# Altium project Karta_Radiowa_ILS_TETRA.PrjPcb (part 4 of 9)

## Sheet CLOC_DISTR.SchDoc: Clock distributions
size A3; SheetNumber: 4; SheetTotal: 17
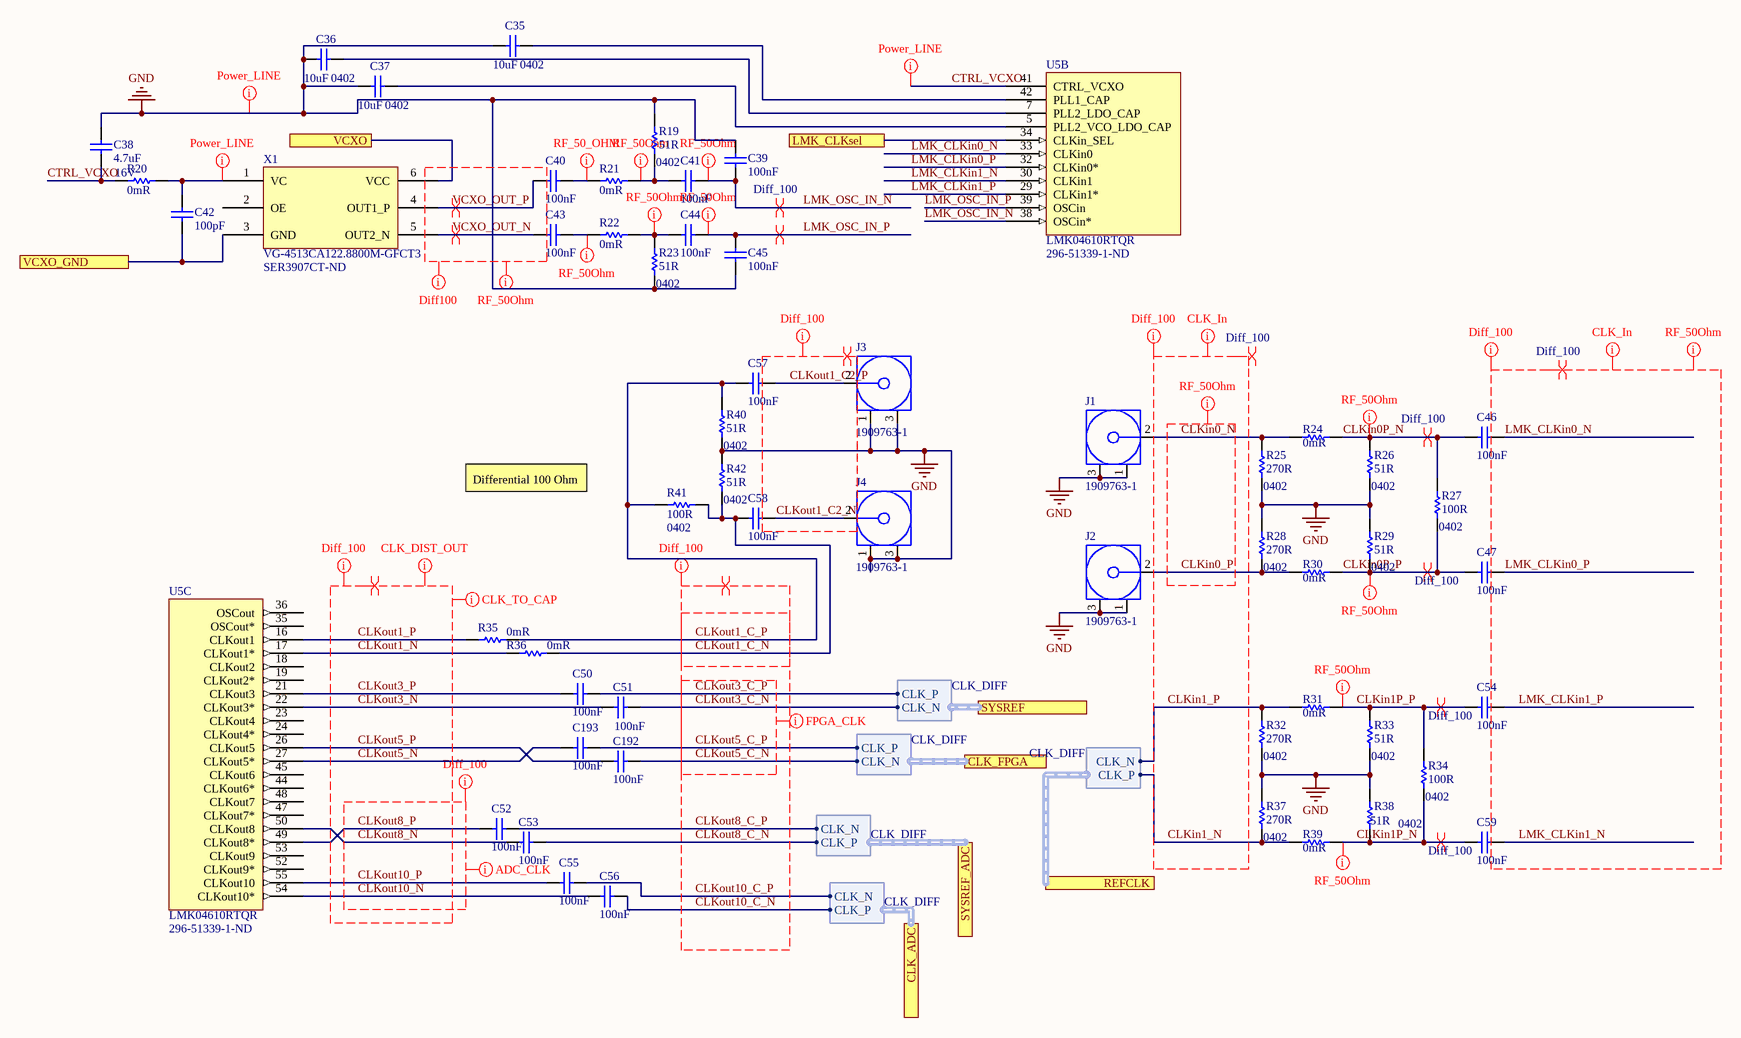
[diagram p4: CLOC_DISTR.SchDoc]

### Parts
C35  10uF  Case/Package: 0402  [CAP 0402/1005 RF KK]
C36  10uF  Case/Package: 0402  [CAP 0402/1005 RF KK]
C37  10uF  Case/Package: 0402  [CAP 0402/1005 RF KK]
C38  4.7uF  Voltage: 16V  [CAP 0603/1608 RF]
C39  100nF  [CAP 0201/0603 KK]
C40  100nF  [CAP 0201/0603 KK]
C41  100nF  [CAP 0201/0603 KK]
C42  100pF  [CAP 0402/1005 RF KK]
C43  100nF  [CAP 0201/0603 KK]
C44  100nF  [CAP 0201/0603 KK]
C45  100nF  [CAP 0201/0603 KK]
C46  100nF  [CAP 0201/0603 KK]
C47  100nF  [CAP 0201/0603 KK]
C50  100nF  [CAP 0201/0603 KK]
C51  100nF  [CAP 0201/0603 KK]
C52  100nF  [CAP 0201/0603 KK]
C53  100nF  [CAP 0201/0603 KK]
C54  100nF  [CAP 0201/0603 KK]
C55  100nF  [CAP 0201/0603 KK]
C56  100nF  [CAP 0201/0603 KK]
C57  100nF  [CAP 0201/0603 KK]
C58  100nF  [CAP 0201/0603 KK]
C59  100nF  [CAP 0201/0603 KK]
C192  100nF  [CAP 0201/0603 KK]
C193  100nF  [CAP 0201/0603 KK]
J1  1909763-1  [TECO-1909763-1_V]
J2  1909763-1  [TECO-1909763-1_V]
J3  1909763-1  [TECO-1909763-1_V]
J4  1909763-1  [TECO-1909763-1_V]
R19  51R  Case/Package: 0402  [RES 0402/1005 RF KK]
R20  0mR  [RES 0402/1005 RF KK]
R21  0mR  [RES 0402/1005 RF KK]
R22  0mR  [RES 0402/1005 RF KK]
R23  51R  Case/Package: 0402  [RES 0402/1005 RF KK]
R24  0mR  [RES 0402/1005 RF KK]
R25  270R  Case/Package: 0402  [RES 0402/1005 RF KK]
R26  51R  Case/Package: 0402  [RES 0402/1005 RF KK]
R27  100R  Case/Package: 0402  [RES 0402/1005 RF KK]
R28  270R  Case/Package: 0402  [RES 0402/1005 RF KK]
R29  51R  Case/Package: 0402  [RES 0402/1005 RF KK]
R30  0mR  [RES 0402/1005 RF KK]
R31  0mR  [RES 0402/1005 RF KK]
R32  270R  Case/Package: 0402  [RES 0402/1005 RF KK]
R33  51R  Case/Package: 0402  [RES 0402/1005 RF KK]
R34  100R  Case/Package: 0402  [RES 0402/1005 RF KK]
R35  0mR  [RES 0402/1005 RF KK]
R36  0mR  [RES 0402/1005 RF KK]
R37  270R  Case/Package: 0402  [RES 0402/1005 RF KK]
R38  51R  Case/Package: 0402  [RES 0402/1005 RF KK]
R39  0mR  [RES 0402/1005 RF KK]
R40  51R  Case/Package: 0402  [RES 0402/1005 RF KK]
R41  100R  Case/Package: 0402  [RES 0402/1005 RF KK]
R42  51R  Case/Package: 0402  [RES 0402/1005 RF KK]
U5  LMK04610RTQR  Supplier Part Number 1: 296-51339-1-ND  [LMK04610]  (parts B,C of 4)
X1  VG-4513CA122.8800M-GFCT3  Supplier Part Number 1: SER3907CT-ND  [VG-4513CA]

### Ports
CLK_ADC (harness CLK_DIFF), CLK_FPGA (harness CLK_DIFF), LMK_CLKsel, REFCLK (harness CLK_DIFF), SYSREF (harness CLK_DIFF), SYSREF_ADC (harness CLK_DIFF), VCXO, VCXO_GND

### Harnesses
CLK_DIFF: CLK_N, CLK_P
CLK_DIFF: CLK_P, CLK_N

### Nets
GND: C35.1 C36.1 C37.1 C38.2 C39.2 C45.1 J1.1 J1.3 J2.1 J2.3 J3.1 J3.3 J4.1 J4.3 R19.2 R23.1 R25.1 R26.1 R28.2 R29.2 R32.1 R33.1 R37.2 R38.2 R40.1 R42.2
CLKin0_N: J1.2 R24.1 R25.2
CLKin0_P: J2.2 R28.1 R30.1
CLKin0P_N: C46.2 R24.2 R26.2 R27.2
CLKin0P_P: C47.2 R27.1 R29.1 R30.2
CLKin1_N: R37.1 R39.1 ; port REFCLK.CLK_P
CLKin1_P: R31.1 R32.2 ; port REFCLK.CLK_N
CLKin1P_N: C59.2 R34.1 R38.1 R39.2
CLKin1P_P: C54.2 R31.2 R33.2 R34.2
CLKout1_C2_N: C58.1 J4.2
CLKout1_C2_P: C57.1 J3.2
CLKout1_C_N: C58.2 R36.2 R41.2 R42.1
CLKout1_C_P: C57.2 R35.2 R40.2 R41.1
CLKout1_N: R36.1 U5.17(CLKout1*)
CLKout1_P: R35.1 U5.16(CLKout1)
CLKout3_C_N: C51.1 ; port SYSREF.CLK_N
CLKout3_C_P: C50.1 ; port SYSREF.CLK_P
CLKout3_N: C51.2 U5.22(CLKout3*)
CLKout3_P: C50.2 U5.21(CLKout3)
CLKout5_C_N: C192.1 ; port CLK_FPGA.CLK_N
CLKout5_C_P: C193.1 ; port CLK_FPGA.CLK_P
CLKout5_N: C193.2 U5.27(CLKout5*)
CLKout5_P: C192.2 U5.26(CLKout5)
CLKout8_C_N: C53.1 ; port SYSREF_ADC.CLK_P
CLKout8_C_P: C52.1 ; port SYSREF_ADC.CLK_N
CLKout8_N: C53.2 U5.50(CLKout8)
CLKout8_P: C52.2 U5.49(CLKout8*)
CLKout10_C_N: C56.1 ; port CLK_ADC.CLK_P
CLKout10_C_P: C55.1 ; port CLK_ADC.CLK_N
CLKout10_N: C56.2 U5.54(CLKout10*)
CLKout10_P: C55.2 U5.55(CLKout10)
CTRL_VCXO: C38.1 R20.1 U5.41(CTRL_VCXO)
GND_VCXO: C42.1 X1.3(GND) ; port VCXO_GND
LMK_CLKin0_N: C46.1 U5.33(CLKin0)
LMK_CLKin0_P: C47.1 U5.32(CLKin0*)
LMK_CLKin1_N: C59.1 U5.30(CLKin1)
LMK_CLKin1_P: C54.1 U5.29(CLKin1*)
LMK_CLKsel: U5.34(CLKin_SEL) ; port LMK_CLKsel
LMK_OSC_IN_N: C39.1 C41.1 U5.38(OSCin*)
LMK_OSC_IN_P: C44.1 C45.2 U5.39(OSCin)
VCXO_OUT_N: C43.2 X1.5(OUT2_N)
VCXO_OUT_P: C40.2 X1.4(OUT1_P)
NetC35_2: C35.2 U5.42(PLL1_CAP)
NetC36_2: C36.2 U5.7(PLL2_LDO_CAP)
NetC37_2: C37.2 U5.5(PLL2_VCO_LDO_CAP)
NetC40_1: C40.1 R21.1
NetC41_2: C41.2 R19.1 R21.2
NetC42_2: C42.2 R20.2 X1.1(VC)
NetC43_1: C43.1 R22.1
NetC44_2: C44.2 R22.2 R23.2
NetC111_2: X1.6(VCC) ; port VCXO

Not connected (* = marked no-connect by the designer): U5 18(CLKout2) 19(CLKout2*) 23(CLKout4) 24(CLKout4*) 35(OSCout*) 36(OSCout) 44(CLKout6*) 45(CLKout6) 47(CLKout7*) 48(CLKout7) 52(CLKout9*) 53(CLKout9); X1 2(OE)

### Layout directives
differential pair; differential pair class Diff_100: CLKin0_N, CLKin0_P, CLKin0P_N, CLKin0P_P, CLKin1_N, CLKin1_P, CLKin1P_N, CLKin1P_P, CLKout1_C2_N, CLKout1_C2_P, CLKout1_C_N, CLKout1_C_P, CLKout1_N, CLKout1_P, CLKout3_C_N, CLKout3_C_P, CLKout3_N, CLKout3_P, CLKout5_C_N, CLKout5_C_P, CLKout5_N, CLKout5_P, CLKout8_C_N, CLKout8_C_P, CLKout8_N, CLKout8_P, CLKout10_C_N, CLKout10_C_P, CLKout10_N, CLKout10_P, LMK_CLKin0_N, LMK_CLKin0_P, LMK_CLKin1_N, LMK_CLKin1_P, LMK_OSC_IN_N, LMK_OSC_IN_P, VCXO_OUT_N, VCXO_OUT_P
net class CLK_In1: CLKin0_N, CLKin0_P, CLKin1_N, CLKin1_P
net class Single50: CLKin0_N, CLKin0_P, CLKin0P_N, CLKin0P_P, CLKin1P_N, CLKin1P_P, LMK_CLKin0_N, LMK_CLKin0_P, LMK_CLKin1_N, LMK_CLKin1_P, LMK_OSC_IN_N, LMK_OSC_IN_P, NetC40_1, NetC41_2, NetC43_1, NetC44_2, VCXO_OUT_N, VCXO_OUT_P
net class CLK_In2: LMK_CLKin0_N, LMK_CLKin0_P, LMK_CLKin1_N, LMK_CLKin1_P
net class Diff_100: CLKin0_N, CLKin0_P, CLKin1_N, CLKin1_P, CLKout1_C2_N, CLKout1_C2_P, CLKout1_C_N, CLKout1_C_P, CLKout1_N, CLKout1_P, CLKout3_C_N, CLKout3_C_P, CLKout3_N, CLKout3_P, CLKout5_C_N, CLKout5_C_P, CLKout5_N, CLKout5_P, CLKout8_C_N, CLKout8_C_P, CLKout8_N, CLKout8_P, CLKout10_C_N, CLKout10_C_P, CLKout10_N, CLKout10_P, LMK_CLKin0_N, LMK_CLKin0_P, LMK_CLKin1_N, LMK_CLKin1_P, VCXO_OUT_N, VCXO_OUT_P
net class Power_LINE: CTRL_VCXO, GND, NetC42_2
net class CLK_DIST_OUT: CLKout1_N, CLKout1_P, CLKout3_N, CLKout3_P, CLKout5_N, CLKout5_P, CLKout8_N, CLKout8_P, CLKout10_N, CLKout10_P
net class CLK_TO_CAP: CLKout1_N, CLKout1_P, CLKout3_N, CLKout3_P, CLKout5_N, CLKout5_P, CLKout8_N, CLKout8_P, CLKout10_N, CLKout10_P
net class FPGA_CLK: CLKout3_C_N, CLKout3_C_P, CLKout5_C_N, CLKout5_C_P
net class ADC_CLK: CLKout8_N, CLKout8_P, CLKout10_N, CLKout10_P

### Notes on the sheet
- Differential 100 Ohm
- Title
- Size:
- Date:
- A3
- Number:
- Time:
- Revision:
- Sheet
- of
- File:

### Library data of the parts
C35-C37 = Capacitor: CAP CER 10UF 6.3V X5R 0402; Manufacturer: Murata; Manufacturer Part Number: GRJ155R60J106ME11D; Tolerance: 20%; Supplier 1: Digi-Key; Supplier Part Number 1: 490-13211-1-ND; RoHS: Yes; Category: Ceramic Capacitors; Stock 1: 1136490; Pricing 1: 1=0,21000, 10=0,14500, 50=0,08680, 100=0,07330, 500=0,05016, 1000=0,04436, 2500=0,04244, 5000=0,03858 (USD); Mount: Surface Mount; Case Code (Metric): 1005; Case Code (Imperial): 0402; Min Operating Temperature: -55°C; Max Operating Temperature: 85°C; Packaging: Cut Tape; Capacitance: 10uF; Voltage Rating: 6.3V; Features: Soft Termination; Length: 0.039inch; Width: 0.02inch; Thickness: 0.028inch; ComponentLink1URL: http://psearch.en.murata.com/capacitor/product/GRJ155R60J106ME11%23.pdf?src-supplier=Digi-Key; ComponentLink1Description: http://psearch.en.murata.com/capacitor/product/GRJ155R60J106ME11%23.pdf?src-supplier=Digi-Key
C38 = Capacitor: TAIYO YUDEN - EMK107ABJ475MA-T - SMD Multilayer Ceramic Capacitor, 4.7 µF, 16 V, 0603 [1608 Metric], ± 20%, X5R, M Series; Supplier 1: Digi-Key; Supplier Part Number 1: 587-6003-1-ND; Manufacturer: Taiyo Yuden; Manufacturer Part Number: EMK107ABJ475MA-T; RoHS: Yes; Category: Ceramic Capacitors; Stock 1: 5; Pricing 1: 1=0,28000, 10=0,19200, 50=0,12820, 100=0,10900, 500=0,07696, 1000=0,06734 (USD); Mount: Surface Mount; Case/Package: Ceramic; Min Operating Temperature: -55°C; Max Operating Temperature: 85°C; Capacitance: 4.7uF; Tolerance: 20%; Packaging: Tape and Reel; Dielectric: X5R; Length: 1.6mm; Height: 0.8mm; Depth: 0.8mm; Radiation Hardening: No; Lead Free: Lead Free; ComponentLink1URL: https://datasheet.ciiva.com/26871/getdatasheetpartid-637315-26871304.pdf?src-supplier=Verical; ComponentLink1Description: https://datasheet.ciiva.com/26871/getdatasheetpartid-637315-26871304.pdf?src-supplier=Verical
C39-C41 C43 C44 C46 C47 C50-C59 C192 C193 = Capacitor: Manufacturer 1: Murata; Manufacturer Part Number 1: GRM033R61C104ME84D; Voltage Rating: 16V; Tolerance: 20%; Dielectric: X5R; Supplier 1: Digi-Key; Supplier Part Number 1: 490-9986-1-ND; Stock 1: 503570; Pricing 1: 1=0.10000, 10=0.05400, 100=0.02430, 500=0.01732, 1000=0.01361, 2500=0.01238, 5000=0.01139 (USD); RoHS: Yes; Mount: Surface Mount; Case/Package: 0201; Weight: 1.2E-05oz; Case Code (Metric): 0603; Case Code (Imperial): 0201; Min Operating Temperature: -55°C; Max Operating Temperature: 85°C; Capacitance: 100nF; Packaging: Tape and Reel; Termination: SMD/SMT; Voltage Rating (DC): 16V; Package Quantity: 15000; Length: 0.024inch; Height: 0.3mm; Width: 0.3mm; Thickness: 0.013inch; ComponentLink1URL: http://www.mouser.com/ds/2/281/c02e-2905.pdf?src-supplier=Mouser; ComponentLink1Description: http://www.mouser.com/ds/2/281/c02e-2905.pdf?src-supplier=Mouser; ComponentLink2URL: http://search.murata.co.jp/Ceramy/image/img/A01X/G101/ENG/GRM033R61C104ME84-01.pdf?src-supplier=Digi-Key; ComponentLink2Description: http://search.murata.co.jp/Ceramy/image/img/A01X/G101/ENG/GRM033R61C104ME84-01.pdf?src-supplier=Digi-Key
C42 = Capacitor: Manufacturer 1: KEMET; Manufacturer Part Number 1: C0402C101J5GACAUTO; Dielectric Material: Ceramic; Tolerance: 5%; Voltage Rating: 50V; Dielectric: C0G; Supplier 1: Digi-Key; Supplier Part Number 1: 399-6823-1-ND; Stock 1: 66452; Pricing 1: 1=0.11000, 10=0.08400, 100=0.03730, 500=0.02664, 1000=0.02093, 2500=0.01903, 5000=0.01751 (USD); RoHS: Yes; Mount: Surface Mount; Case/Package: 0402; Case Code (Metric): 1005; Case Code (Imperial): 0402; Min Operating Temperature: -55°C; Max Operating Temperature: 125°C; Package Quantity: 10000; Capacitance: 100pF; Packaging: Tape and Reel; Voltage Rating (DC): 50V; Length: 1mm; Width: 0.02inch; Thickness: 0.022inch; Depth: 0.5mm; Ratings: AEC-Q200; Radiation Hardening: No; REACH SVHC: No SVHC; Lead Free: Lead Free; ComponentLink1URL: https://datasheet.ciiva.com/26923/getdatasheetpartid-385375-26923866.pdf?src-supplier=Verical; ComponentLink1Description: https://datasheet.ciiva.com/26923/getdatasheetpartid-385375-26923866.pdf?src-supplier=Verical
C45 = Capacitor: Manufacturer 1: Yageo; Manufacturer Part Number 1: CC0201KRX5R6BB104; Voltage Rating (DC): 10V; Tolerance: 10%; Dielectric: X5R; Supplier 1: Digi-Key; Supplier Part Number 1: 311-1593-1-ND; Stock 1: 1229391; Pricing 1: 1=0.10000, 10=0.03800, 100=0.01690, 500=0.01208, 1000=0.00949, 2500=0.00862, 5000=0.00794 (USD); RoHS: Yes; Mount: Surface Mount; Case/Package: 0201; Weight: 6E-06oz; Case Code (Imperial): 0201; Case Code (Metric): 0603; Min Operating Temperature: -55°C; Max Operating Temperature: 85°C; Capacitance: 100nF; Packaging: Tape and Reel; Termination: SMD/SMT; Composition: Ceramic; Voltage Rating: 10V; Length: 0.6mm; Height: 0.3mm; Width: 0.012inch; Thickness: 0.013inch; Depth: 0.3mm; Radiation Hardening: No; Lead Free: Lead Free; Halogen Free: Halogen Free; ComponentLink1URL: https://datasheet.ciiva.com/17437/upy-gphc-x5r-4v-to-50v-12-17437495.pdf?src-supplier=Avnet+Europe; ComponentLink1Description: https://datasheet.ciiva.com/17437/upy-gphc-x5r-4v-to-50v-12-17437495.pdf?src-supplier=Avnet+Europe; ComponentLink2URL: https://datasheet.ciiva.com/11587/upy-gphc-x5r-4v-to-50v-12-11587190.pdf?src-supplier=Avnet; ComponentLink2Description: https://datasheet.ciiva.com/11587/upy-gphc-x5r-4v-to-50v-12-11587190.pdf?src-supplier=Avnet
J1-J4 = 1909763-1: Ultra Miniature Coaxial Connector Jack, 60 V, 50 Ohm, -40 to 90 degC, RoHS, Tape and Reel; Brand: TE Connectivity / AMP; Maximum Frequency: 6 GHz; Gender: Jack (Female); Body Material: Liquid Crystal Polymer (LCP); RF Series: UMCC; Impedance: 50 Ohms; DatasheetVersion: Rev. B2; PackageReference: SMD; PackageDescription: 3-Pin Surface Mount Device, Body 2.6 x 2.6 mm; Supplier 1: Newark; Supplier Part Number 1: 62X0488; Supplier 2: Farnell; Supplier Part Number 2: 2781689; Supplier 3: Digi-Key; Supplier Part Number 3: A118077TR-ND; Supplier 4: Digi-Key; Supplier Part Number 4: A118077CT-ND; Supplier 5: Digi-Key; Supplier Part Number 5: A118077DKR-ND; Product Category: RF Connectors / Coaxial Connectors; Packaging: Reel; Product: Connectors; Orientation: Straight; Operating Temperature Range: - 40 C to + 90 C; Factory Pack Quantity: 5000; RoHS: Details; Contact Plating: Gold; Contact Material: Copper Alloy; Mounting Technology: Surface Mount; ComponentLink1Description: Manufacturer URL; ComponentLink1URL: http://www.te.com; ComponentLink2Description: Datasheet; ComponentLink2URL: http://www.te.com/commerce/DocumentDelivery/DDEController?Action=srchrtrv&DocNm=1909763&DocType=Customer+Drawing&DocLang=English
R19 R23 R26 R29 R33 R38 R40 R42 = Resistor: RES SMD 51 OHM 0.5% 1/16W 0402; Manufacturer: Panasonic; Manufacturer Part Number: ERA-2AED510X; Temperature Coefficient: 25ppm/°C; Power Rating: 62.5mW; Max Power Dissipation: 63mW; Supplier 1: Digi-Key; Supplier Part Number 1: P51DECT-ND; RoHS: Yes; Category: Chip SMD Resistors; Stock 1: 20961; Pricing 1: 1=0,21000, 10=0,17900, 100=0,07000, 1000=0,02930, 2500=0,02686, 5000=0,02442 (USD); Mount: Surface Mount; Case Code (Metric): 1005; Case Code (Imperial): 0402; Contact Plating: Tin; Min Operating Temperature: -55°C; Max Operating Temperature: 155°C; Features: Automotive AEC-Q200; Resistance: 51R; Tolerance: 0.5%; Packaging: Tape and Reel; Package Quantity: 1; Composition: Thin Film,Metal Film; Number of Terminations: 2; Military Standard: Not; Length: 1mm; Height: 0.016inch; Depth: 0.5mm; Width: 0.02inch; Lead Free: Lead Free; ComponentLink1URL: https://datasheet.ciiva.com/9189/aoa0000ce26-9189082.pdf?src-supplier=Avnet; ComponentLink1Description: https://datasheet.ciiva.com/9189/aoa0000ce26-9189082.pdf?src-supplier=Avnet
R20-R22 R24 R30 R31 R35 R36 R39 = Resistor: YAGEO - RC0402JR-070RL. - RES, THICK FILM, 0R, 0.0625W, 0402; Power Rating: 62.5mW; Tolerance: 5%; Voltage Rating: 50V; Max Power Dissipation: 63mW; Temperature Coefficient: 200ppm/°C; Supplier 1: Digi-Key; Supplier Part Number 1: 311-0.0JRCT-ND; Manufacturer: Yageo; Manufacturer Part Number: RC0402JR-070RL; RoHS: Yes; Category: Chip SMD Resistors; Stock 1: 45338179; Pricing 1: 1=0,10000, 10=0,01200, 25=0,00920, 50=0,00680, 100=0,00510, 250=0,00388, 500=0,00310, 1000=0,00228, 5000=0,00163 (USD); Case/Package: 0402; Case Code (Metric): 1005; Case Code (Imperial): 0402; Contact Plating: Tin,Matte; Min Operating Temperature: -55°C; Max Operating Temperature: 155°C; Package Quantity: 1; Resistance: 0mR; Packaging: Tape and Reel; Resistor Type: Thick Film; Number of Terminations: 2; Termination: SMD/SMT; Features: Moisture Resistant; Length: 1mm; Height: 0.016inch; Width: 0.02inch; Depth: 0.5mm; Radiation Hardening: No; REACH SVHC: Unknown; Military Standard: Not; Lead Free: Lead Free; ComponentLink1URL: https://datasheet.ciiva.com/2452/pyu-rc0402-51-rohs-l-6-2452608.pdf?src-supplier=Digi-Key; ComponentLink1Description: https://datasheet.ciiva.com/2452/pyu-rc0402-51-rohs-l-6-2452608.pdf?src-supplier=Digi-Key; ComponentLink2URL: https://datasheet.ciiva.com/11808/0900766b80c66297-11808195.pdf?src-supplier=RSComponents; ComponentLink2Description: https://datasheet.ciiva.com/11808/0900766b80c66297-11808195.pdf?src-supplier=RSComponents; ComponentLink3URL: https://datasheet.ciiva.com/2452/pyu-r-int-thick-7-2452609.pdf?src-supplier=Digi-Key; ComponentLink3Description: https://datasheet.ciiva.com/2452/pyu-r-int-thick-7-2452609.pdf?src-supplier=Digi-Key; ComponentLink4URL: https://datasheet.ciiva.com/2452/pyu-r-int-thick-7-2452610.pdf?src-supplier=Digi-Key; ComponentLink4Description: https://datasheet.ciiva.com/2452/pyu-r-int-thick-7-2452610.pdf?src-supplier=Digi-Key; ComponentLink5URL: https://datasheet.ciiva.com/8896/pyu-rc0402-51-rohs-l-6-8896201.pdf?src-supplier=Avnet; ComponentLink5Description: https://datasheet.ciiva.com/8896/pyu-rc0402-51-rohs-l-6-8896201.pdf?src-supplier=Avnet; ComponentLink6URL: https://datasheet.ciiva.com/28386/pyu-rc0402-51-rohs-l-6-28386633.pdf?src-supplier=Avnet+Europe; ComponentLink6Description: https://datasheet.ciiva.com/28386/pyu-rc0402-51-rohs-l-6-28386633.pdf?src-supplier=Avnet+Europe; ComponentLink7URL: https://datasheet.ciiva.com/22747/1018594-22747515.pdf?src-supplier=Element14; ComponentLink7Description: https://datasheet.ciiva.com/22747/1018594-22747515.pdf?src-supplier=Element14; ComponentLink8URL: https://datasheet.ciiva.com/15189/getdatasheetpartid-326379-15189533.pdf?src-supplier=Verical; ComponentLink8Description: https://datasheet.ciiva.com/15189/getdatasheetpartid-326379-15189533.pdf?src-supplier=Verical
R25 R28 R32 R37 = Resistor: RESISTOR, METAL FILM, 270 OHM, 0.5%,0402; Manufacturer: Panasonic; Manufacturer Part Number: ERA-2AED271X; Temperature Coefficient: 25ppm/°C; Voltage Rating (DC): 25V; Max Power Dissipation: 63mW; Power Rating: 62.5mW; Supplier 1: Digi-Key; Supplier Part Number 1: P270DECT-ND; RoHS: Yes; Category: Chip SMD Resistors; Stock 1: 15767; Pricing 1: 1=0,21000, 10=0,17900, 100=0,07000, 1000=0,02930, 2500=0,02686, 5000=0,02442 (USD); Mount: Surface Mount; Contact Plating: Tin; Case Code (Imperial): 0402; Case Code (Metric): 1005; Min Operating Temperature: -55°C; Max Operating Temperature: 155°C; Features: Automotive AEC-Q200; Termination: SMD/SMT; Composition: Thin Film,Metal Film; Number of Terminations: 2; Resistance: 270R; Packaging: Tape and Reel; Tolerance: 0.5%; Package Quantity: 10000; Voltage Rating: 25V; Length: 0.039inch; Height: 0.016inch; Width: 0.02inch; Lead Free: Lead Free; REACH SVHC: No SVHC; ComponentLink1URL: https://datasheet.ciiva.com/9183/aoa0000ce26-9183624.pdf?src-supplier=Avnet; ComponentLink1Description: https://datasheet.ciiva.com/9183/aoa0000ce26-9183624.pdf?src-supplier=Avnet; ComponentLink2URL: https://datasheet.ciiva.com/46378/1776116-46378222.pdf?src-supplier=Element14; ComponentLink2Description: https://datasheet.ciiva.com/46378/1776116-46378222.pdf?src-supplier=Element14
R27 R34 R41 = Resistor: YAGEO - RC0402FR-07100RL. - RES, THICK FILM, 100R, 1%, 0.0625W, 0402, REEL; Temperature Coefficient: 100ppm/°C; Power Rating: 62.5mW; Voltage Rating: 50V; Supplier 1: Digi-Key; Supplier Part Number 1: 311-100LRCT-ND; Manufacturer: Yageo; Manufacturer Part Number: RC0402FR-07100RL; RoHS: Yes; Category: Chip SMD Resistors; Stock 1: 31356128; Pricing 1: 1=0,10000, 10=0,01600, 100=0,00640, 1000=0,00289, 2500=0,00251, 5000=0,00207 (USD); Number of Pins: 2; Case Code (Imperial): 0402; Case Code (Metric): 1005; Min Operating Temperature: -55°C; Max Operating Temperature: 155°C; Military Standard: Not; Tolerance: 1%; Resistance: 100R; Packaging: Tape and Reel; Termination: SMD/SMT; Composition: Thick Film; Voltage Rating (DC): 50V; Length: 1mm; Height: 0.32mm; Depth: 0.5mm; Width: 0.5mm; Lead Free: Lead Free; REACH SVHC: No SVHC; ComponentLink1URL: https://datasheet.ciiva.com/7849/1784430-7849810.pdf?src-supplier=Element14; ComponentLink1Description: https://datasheet.ciiva.com/7849/1784430-7849810.pdf?src-supplier=Element14; ComponentLink2URL: https://datasheet.ciiva.com/11808/0900766b80c66297-11808765.pdf?src-supplier=RSComponents; ComponentLink2Description: https://datasheet.ciiva.com/11808/0900766b80c66297-11808765.pdf?src-supplier=RSComponents; ComponentLink3URL: https://datasheet.ciiva.com/16740/pyu-rc0402-51-rohs-l-6-r-16740566.pdf?src-supplier=Future+Electronics; ComponentLink3Description: https://datasheet.ciiva.com/16740/pyu-rc0402-51-rohs-l-6-r-16740566.pdf?src-supplier=Future+Electronics; ComponentLink4URL: https://datasheet.ciiva.com/15189/getdatasheetpartid-329466-15189335.pdf?src-supplier=Verical; ComponentLink4Description: https://datasheet.ciiva.com/15189/getdatasheetpartid-329466-15189335.pdf?src-supplier=Verical; ComponentLink5URL: https://datasheet.ciiva.com/28367/1018594-28367226.pdf?src-supplier=Element14; ComponentLink5Description: https://datasheet.ciiva.com/28367/1018594-28367226.pdf?src-supplier=Element14; ComponentLink6URL: https://datasheet.ciiva.com/12667/pyu-rc0402-51-rohs-l-6-r-12667957.pdf?src-supplier=Mouser; ComponentLink6Description: https://datasheet.ciiva.com/12667/pyu-rc0402-51-rohs-l-6-r-12667957.pdf?src-supplier=Mouser; ComponentLink7URL: https://datasheet.ciiva.com/22747/1018594-22747511.pdf?src-supplier=Element14; ComponentLink7Description: https://datasheet.ciiva.com/22747/1018594-22747511.pdf?src-supplier=Element14
U5 = LMK04610RTQR: LMK04610RTQT; Manufacturer: Texas Instruments; Number of Inputs: 2; Number of Outputs: 10; PLL: Yes; Input: LVCMOS; Number of Circuits: 1; Max Frequency: 6.175GHz; Supplier 1: Digi-Key; Manufacturer Part Number: LMK04610RTQR; Stock 1: 2022; Pricing 1: 1 = 20,47000, 10 = 18,87700, 100 = 16,11940, 500 = 14,63474 (USD); RoHS: No; Min Operating Temperature: -40°C; Max Operating Temperature: 85°C; Supplier 2: Digi-Key; Supplier Part Number 2: 296-48594-1-ND; Category: Clock Generators, PLLs, Frequency Synthesizers; Stock 2: 150; Pricing 2: 1=32,35000, 10=29,84000, 25=28,49880, 100=25,48130 (USD); Mount: Surface Mount; Case/Package: QFN; Packaging: Tape and Reel; ComponentLink1URL: http://www.ti.com/lit/ds/symlink/lmk04610.pdf?src-supplier=Digi-Key; ComponentLink1Description: http://www.ti.com/lit/ds/symlink/lmk04610.pdf?src-supplier=Digi-Key
X1 = VG-4513CA122.8800M-GFCT3: OSC VCXO 122.88MHZ LVPECL SMD; Manufacturer: Epson; Max Supply Current: 65mA; Supplier 1: Digi-Key; Manufacturer Part Number: VG-4513CA122.8800M-GFCT3; Stock 1: 438; Pricing 1: 1 = 9,91000, 10 = 9,29000, 50 = 8,97980, 100 = 8,67020 (USD); RoHS: Yes; Mount: Surface Mount; Case/Package: SMD/SMT; Min Operating Temperature: -40°C; Max Operating Temperature: 85°C; Packaging: Tape and Reel; Frequency: 122.88MHz; Length: 0.276inch; Height: 0.071inch; Width: 0.197inch; Lead Free: Lead Free; ComponentLink1URL: https://datasheet.ciiva.com/29626/vg-4513ca-partnumber-29626986.pdf?src-supplier=Digi-Key; ComponentLink1Description: https://datasheet.ciiva.com/29626/vg-4513ca-partnumber-29626986.pdf?src-supplier=Digi-Key; ComponentLink2URL: https://datasheet.ciiva.com/29626/vg-4513ca-partnumber-29626987.pdf?src-supplier=Digi-Key; ComponentLink2Description: https://datasheet.ciiva.com/29626/vg-4513ca-partnumber-29626987.pdf?src-supplier=Digi-Key; ComponentLink3URL: https://datasheet.ciiva.com/29626/076-vg-4513ca-cb-e13ya-29626988.pdf?src-supplier=Digi-Key; ComponentLink3Description: https://datasheet.ciiva.com/29626/076-vg-4513ca-cb-e13ya-29626988.pdf?src-supplier=Digi-Key

## Sheet RF_LANES.SchDoc: RF
size A3; SheetNumber: 6; SheetTotal: 17
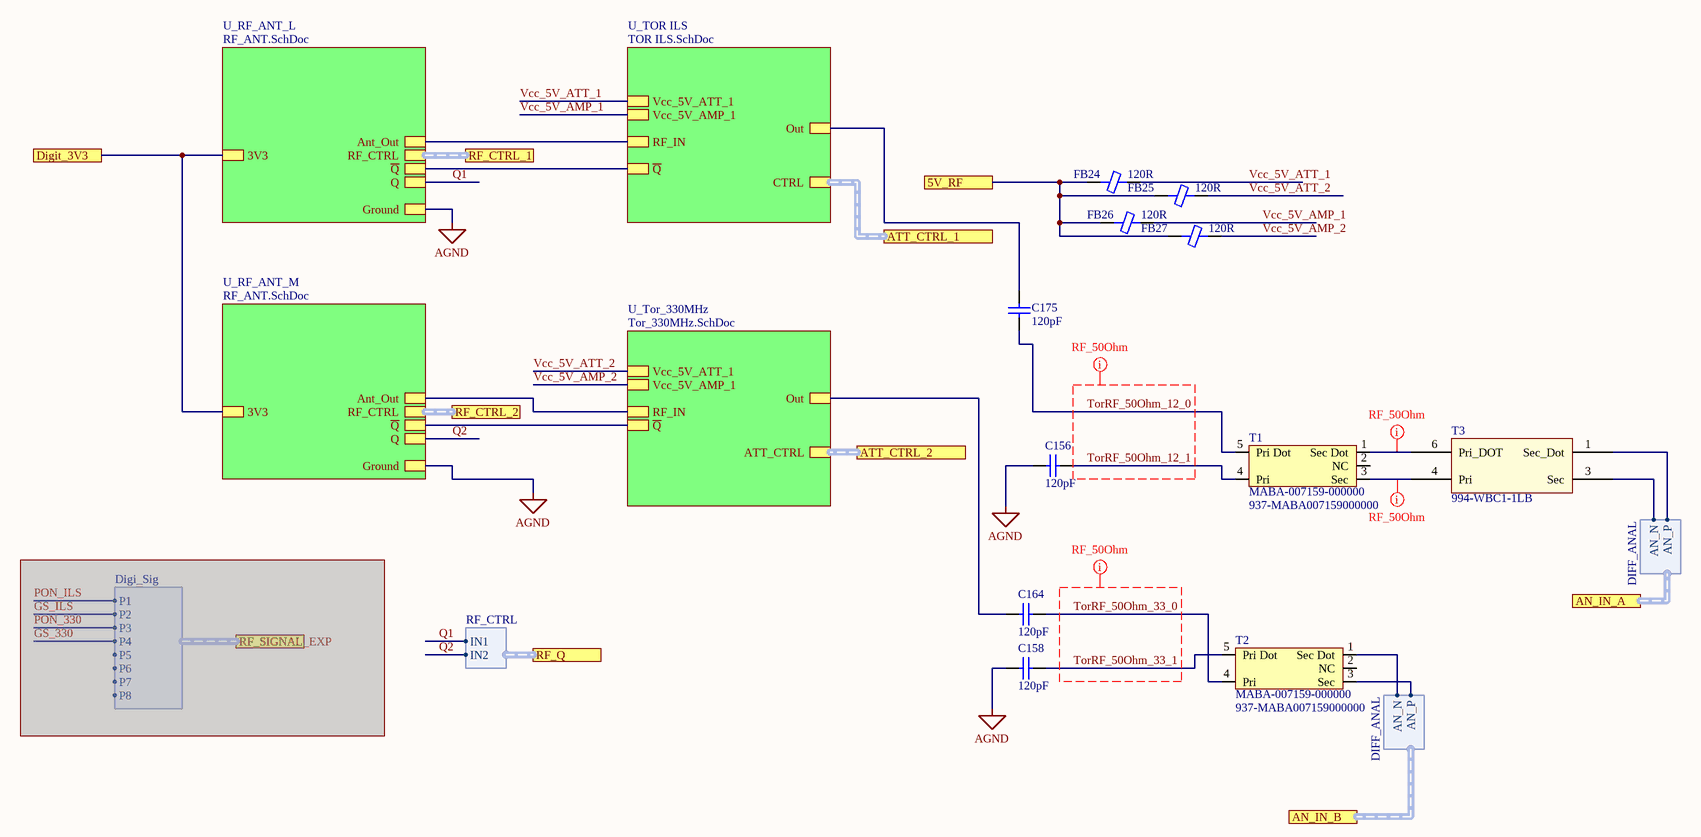
[diagram p5: RF_LANES.SchDoc]

### Parts
C156  120pF  [CAP 0402/1005 RF KK]
C158  120pF  [CAP 0402/1005 RF KK]
C164  120pF  [CAP 0402/1005 RF KK]
C175  120pF  [CAP 0402/1005 RF KK]
FB24  120R  [FER 0402/1005 KK]
FB25  120R  [FER 0402/1005 KK]
FB26  120R  [FER 0402/1005 KK]
FB27  120R  [FER 0402/1005 KK]
T1  MABA-007159-000000  Supplier Part Number 1: 937-MABA007159000000  [MABA-007159-000000]
T2  MABA-007159-000000  Supplier Part Number 1: 937-MABA007159000000  [MABA-007159-000000]
T3  Supplier Part Number 1: 994-WBC1-1LB  [WBC Series SMT Mini Wideband Transformers]  (hidden comment: WBC1-1LB)

### Sub-sheets
U_RF_ANT_L = RF_ANT.SchDoc: Ground, Ant_Out, ~{Q}, RF_CTRL (harness RF_CTRL), 3V3, Q
U_RF_ANT_M = RF_ANT.SchDoc: Ground, Ant_Out, ~{Q}, RF_CTRL (harness RF_CTRL), 3V3, Q
U_TOR ILS = TOR ILS.SchDoc: Vcc_5V_ATT_1, Vcc_5V_AMP_1, RF_IN, Out, CTRL, ~{Q}
U_Tor_330MHz = Tor_330MHz.SchDoc: ATT_CTRL, Vcc_5V_ATT_1, Out, RF_IN, Vcc_5V_AMP_1, ~{Q}

### Ports
5V_RF, AN_IN_A (harness DIFF_ANAL), AN_IN_B (harness DIFF_ANAL), ATT_CTRL_1 (harness ATT_CTRL), ATT_CTRL_2 (harness ATT_CTRL), Digit_3V3, RF_CTRL_1, RF_CTRL_2, RF_Q (harness RF_CTRL), RF_SIGNAL_EXP (harness Digi_Sig)

### Harnesses
Digi_Sig: P1, P2, P3, P4, P5, P6, P7, P8
DIFF_ANAL: AN_P, AN_N
RF_CTRL: IN1, IN2

### Nets
AGND: C156.2 C158.1 ; sheet U_RF_ANT_L/Ground, sheet U_RF_ANT_M/Ground  [project net GND_ATT]
3V3_DIGIT: port Digit_3V3, sheet U_RF_ANT_L/3V3, sheet U_RF_ANT_M/3V3
5V: FB24.1 FB25.1 FB26.1 FB27.1 ; port 5V_RF
Ain_2122A_N: T3.3(Sec) ; port AN_IN_A.AN_N
AIn_2122A_P: T3.1(Sec_Dot) ; port AN_IN_A.AN_P
AIn_2122B_N: T2.1(Sec_Dot) ; port AN_IN_B.AN_N
AIn_2122B_P: T2.3(Sec) ; port AN_IN_B.AN_P
Q1: sheet U_RF_ANT_L/Q, port RF_Q.IN1  [project net Q]
Q2: sheet U_RF_ANT_M/Q, port RF_Q.IN2  [project net Q]
~{Q}: sheet U_TOR ILS/~{Q}, sheet U_RF_ANT_L/~{Q}
~{Q}: sheet U_RF_ANT_M/~{Q}, sheet U_Tor_330MHz/~{Q}  [a separate net that carries the same name]
TorRF_50Ohm_12_0: C175.1 T1.5(Pri_Dot)
TorRF_50Ohm_12_1: C156.1 T1.4(Pri)
TorRF_50Ohm_33_0: C164.2 T2.4(Pri)
TorRF_50Ohm_33_1: C158.2 T2.5(Pri_Dot)
Vcc_5V_AMP_1: FB26.2 ; sheet U_TOR ILS/Vcc_5V_AMP_1
Vcc_5V_AMP_2: FB27.2 ; sheet U_Tor_330MHz/Vcc_5V_AMP_1
Vcc_5V_ATT_1: FB24.2 ; sheet U_TOR ILS/Vcc_5V_ATT_1
Vcc_5V_ATT_2: FB25.2 ; sheet U_Tor_330MHz/Vcc_5V_ATT_1
NetC164_1: C164.1 ; sheet U_Tor_330MHz/Out
NetC175_2: C175.2 ; sheet U_TOR ILS/Out
NetR9_U_RF_ANT_L_2: sheet U_TOR ILS/RF_IN, sheet U_RF_ANT_L/Ant_Out
NetR9_U_RF_ANT_M_2: sheet U_RF_ANT_M/Ant_Out, sheet U_Tor_330MHz/RF_IN
NetT1_1: T1.1(Sec_Dot) T3.6(Pri_DOT)
NetT1_3: T1.3(Sec) T3.4(Pri)

Not connected (* = marked no-connect by the designer): T1 2(NC); T2 2(NC)

### Buses and harness runs
harness port ATT_CTRL_1 = sheet U_TOR ILS/CTRL
harness port ATT_CTRL_2 = sheet U_Tor_330MHz/ATT_CTRL
harness port RF_CTRL_1 = sheet U_RF_ANT_L/RF_CTRL
harness port RF_CTRL_2 = sheet U_RF_ANT_M/RF_CTRL

### Layout directives
net class Single50: NetT1_1, NetT1_3, TorRF_50Ohm_12_0, TorRF_50Ohm_12_1, TorRF_50Ohm_33_0, TorRF_50Ohm_33_1

### Notes on the sheet
- Title
- Size:
- Date:
- A3
- Number:
- Time:
- Revision:
- Sheet
- of
- File:

### Library data of the parts
C156 C158 C164 C175 = Capacitor: CAP CER 120PF 25V C0G/NP0 0402; Manufacturer: KEMET; Manufacturer Part Number: C0402C121J3GAC7867; Tolerance: 5%; Supplier 1: Digi-Key; Supplier Part Number 1: 399-14880-1-ND; RoHS: No; Category: Ceramic Capacitors; Stock 1: 43311; Pricing 1: 1=0,10000, 10=0,04100, 50=0,02260, 100=0,01840, 500=0,01312, 1000=0,01032, 2500=0,00938, 5000=0,00863 (USD); Mount: Surface Mount; Case/Package: 0402; Case Code (Imperial): 0402; Case Code (Metric): 1005; Min Operating Temperature: -55°C; Max Operating Temperature: 125°C; Packaging: Tape and Reel; Capacitance: 120pF; Voltage Rating: 25V; ComponentLink1URL: https://api.kemet.com/component-edge/download/datasheet/C0402C121J3GAC7867.pdf?src-supplier=Digi-Key; ComponentLink1Description: https://api.kemet.com/component-edge/download/datasheet/C0402C121J3GAC7867.pdf?src-supplier=Digi-Key
FB24-FB27 = Ferrite: FERRITE BEAD 120 OHM 0402 1LN; Manufacturer: Murata; Manufacturer Part Number: BLM15BB121SN1D; Material: Ferrite,Steel; Tolerance: 25%; Current Rating: 300mA; DC Resistance (DCR): 550mR; Test Frequency: 100MHz; Shielding: Unshielded; Number of Lines: 1; Supplier 1: Digi-Key; Supplier Part Number 1: 490-1008-1-ND; RoHS: Yes; Category: Inductors; Stock 1: 72662; Pricing 1: 1=0,10000, 10=0,08300, 25=0,07440, 50=0,05440, 100=0,04700, 250=0,03712, 500=0,03136, 1000=0,02640, 5000=0,02351 (USD); Case/Package: 0402; Number of Pins: 2; Case Code (Metric): 1005; Case Code (Imperial): 0402; Core Material: Ferrite; Min Operating Temperature: -55°C; Max Operating Temperature: 125°C; Package Quantity: 1; Packaging: Tape and Reel; Max DC Current: 300mA; Termination: SMD/SMT; Frequency: 100MHz; Resistor Type: Ferrite Bead; Impedance: 120R; Max Current Rating: 300mA; Number of Circuits: 1; Length: 1mm; Height: 0.5mm; Width: 0.5mm; Depth: 0.5mm; Lead Free: Lead Free; REACH SVHC: No SVHC; ComponentLink1URL: https://datasheet.ciiva.com/1466/5145-1466832.pdf?src-supplier=Element14; ComponentLink1Description: https://datasheet.ciiva.com/1466/5145-1466832.pdf?src-supplier=Element14; ComponentLink2URL: https://datasheet.ciiva.com/41449/001172179-da-01-en-drossel-0402-120r-1-0x0-5mm-10000st-41449466.pdf?src-supplier=Conrad; ComponentLink2Description: https://datasheet.ciiva.com/41449/001172179-da-01-en-drossel-0402-120r-1-0x0-5mm-10000st-41449466.pdf?src-supplier=Conrad; ComponentLink3URL: https://datasheet.ciiva.com/1466/5145-1466833.pdf?src-supplier=Element14; ComponentLink3Description: https://datasheet.ciiva.com/1466/5145-1466833.pdf?src-supplier=Element14; ComponentLink4URL: https://datasheet.ciiva.com/3082/l0110s0100blm15b-3082680.pdf?src-supplier=Avnet; ComponentLink4Description: https://datasheet.ciiva.com/3082/l0110s0100blm15b-3082680.pdf?src-supplier=Avnet; ComponentLink5URL: https://datasheet.ciiva.com/16213/l0110s0100blm15b-16213674.pdf?src-supplier=Future+Electronics; ComponentLink5Description: https://datasheet.ciiva.com/16213/l0110s0100blm15b-16213674.pdf?src-supplier=Future+Electronics; ComponentLink6URL: https://datasheet.ciiva.com/1012/l0110s0100blm15b-1012029.pdf?src-supplier=Digi-Key; ComponentLink6Description: https://datasheet.ciiva.com/1012/l0110s0100blm15b-1012029.pdf?src-supplier=Digi-Key; ComponentLink7URL: https://datasheet.ciiva.com/1012/l0110s0100blm15b-1012030.pdf?src-supplier=Digi-Key; ComponentLink7Description: https://datasheet.ciiva.com/1012/l0110s0100blm15b-1012030.pdf?src-supplier=Digi-Key; ComponentLink8URL: https://datasheet.ciiva.com/1012/l0110s0100blm15b-1012031.pdf?src-supplier=Digi-Key; ComponentLink8Description: https://datasheet.ciiva.com/1012/l0110s0100blm15b-1012031.pdf?src-supplier=Digi-Key
T1 T2 = MABA-007159-000000: Manufacturer: TE Connectivity MA-COM; Turns Ratio: 1:1; Power Rating: 250mW; Max DC Current: 30mA; Lead/Base Style: Gull Wing; Supplier 1: Mouser; Manufacturer Part Number: MABA-007159-000000; Stock 1: 6455; Pricing 1: 1 = 1,75000, 10 = 1,41000, 50 = 1,41000, 100 = 1,13000, 1000 = 0,88000, 10000 = 0,68800 (USD); RoHS: Yes; Mount: Surface Mount; Case/Package: SMD/SMT; Number of Pins: 5; Min Operating Temperature: -40°C; Max Operating Temperature: 85°C; Packaging: Tape and Reel; Package Quantity: 2000; Termination: SMD/SMT; Length: 3.81mm; Height: 2.67mm; Width: 3.81mm; Depth: 3.81mm; Radiation Hardening: No; Lead Free: Lead Free; ComponentLink1URL: https://datasheet.ciiva.com/3295/maba-007159-000000-3295941.pdf?src-supplier=Avnet; ComponentLink1Description: https://datasheet.ciiva.com/3295/maba-007159-000000-3295941.pdf?src-supplier=Avnet; ComponentLink2URL: https://datasheet.ciiva.com/4550/maba-007159-000000-13414-4550885.pdf?src-supplier=Mouser; ComponentLink2Description: https://datasheet.ciiva.com/4550/maba-007159-000000-13414-4550885.pdf?src-supplier=Mouser; ComponentLink3URL: https://datasheet.ciiva.com/29655/maba-007159-000000-29655720.pdf?src-supplier=Digi-Key; ComponentLink3Description: https://datasheet.ciiva.com/29655/maba-007159-000000-29655720.pdf?src-supplier=Digi-Key; ComponentLink4URL: https://datasheet.ciiva.com/29655/maba-007159-000000-29655722.pdf?src-supplier=Digi-Key; ComponentLink4Description: https://datasheet.ciiva.com/29655/maba-007159-000000-29655722.pdf?src-supplier=Digi-Key
T3 = WBC1-1LB: Wideband RF transformer, SMT, RoHS; Manufacturer: Coilcraft; Core Material: Ferrite; Current Rating: 250mA; Shielding: Unshielded; Inductance: 10uH; Isolation Voltage: 300V; DC Resistance (DCR): 120mR; Power Rating: 250mW; Supplier 1: Mouser; Manufacturer Part Number: WBC1-1LB; RoHS: Yes; Category: Transformers; Stock 1: 958; Pricing 1: 1=3,70000, 10=3,33000, 50=2,96000, 100=2,59000, 200=2,33000, 500=2,14000, 750=1,99000 (USD); Min Operating Temperature: -40°C; Max Operating Temperature: 85°C; Termination: SMD/SMT; Packaging: Tape and Reel; Package Quantity: 100; Length: 4.45mm; Height: 3.05mm; Width: 4.19mm; REACH SVHC: No SVHC; Lead Free: Contains Lead; ComponentLink1URL: http://www.farnell.com/datasheets/1870445.pdf?src-supplier=Farnell; ComponentLink1Description: http://www.farnell.com/datasheets/1870445.pdf?src-supplier=Farnell; ComponentLink2URL: http://www.mouser.com/ds/2/597/wbc-463492.pdf?src-supplier=Mouser; ComponentLink2Description: http://www.mouser.com/ds/2/597/wbc-463492.pdf?src-supplier=Mouser; ComponentLink3URL: http://www.farnell.com/datasheets/1870445.pdf?src-supplier=Element14; ComponentLink3Description: http://www.farnell.com/datasheets/1870445.pdf?src-supplier=Element14